# EasyEDA Pro project ProPrj_CraftVia-Core-S-G431-v1-Rev0_2026-10-26.epro

# Schematic Core-S-G431-v1-Rev0
Board Name: Board1; Create Date: 2026-09-03; Page Name: P1; Project Name: CraftVia-Core-S-G431-v1-Rev0; Schematic Name: Schematic1; Update Date: 2026-09-03; Company: CraftVia.org; Page Size: A3; Version: V1 Rev0
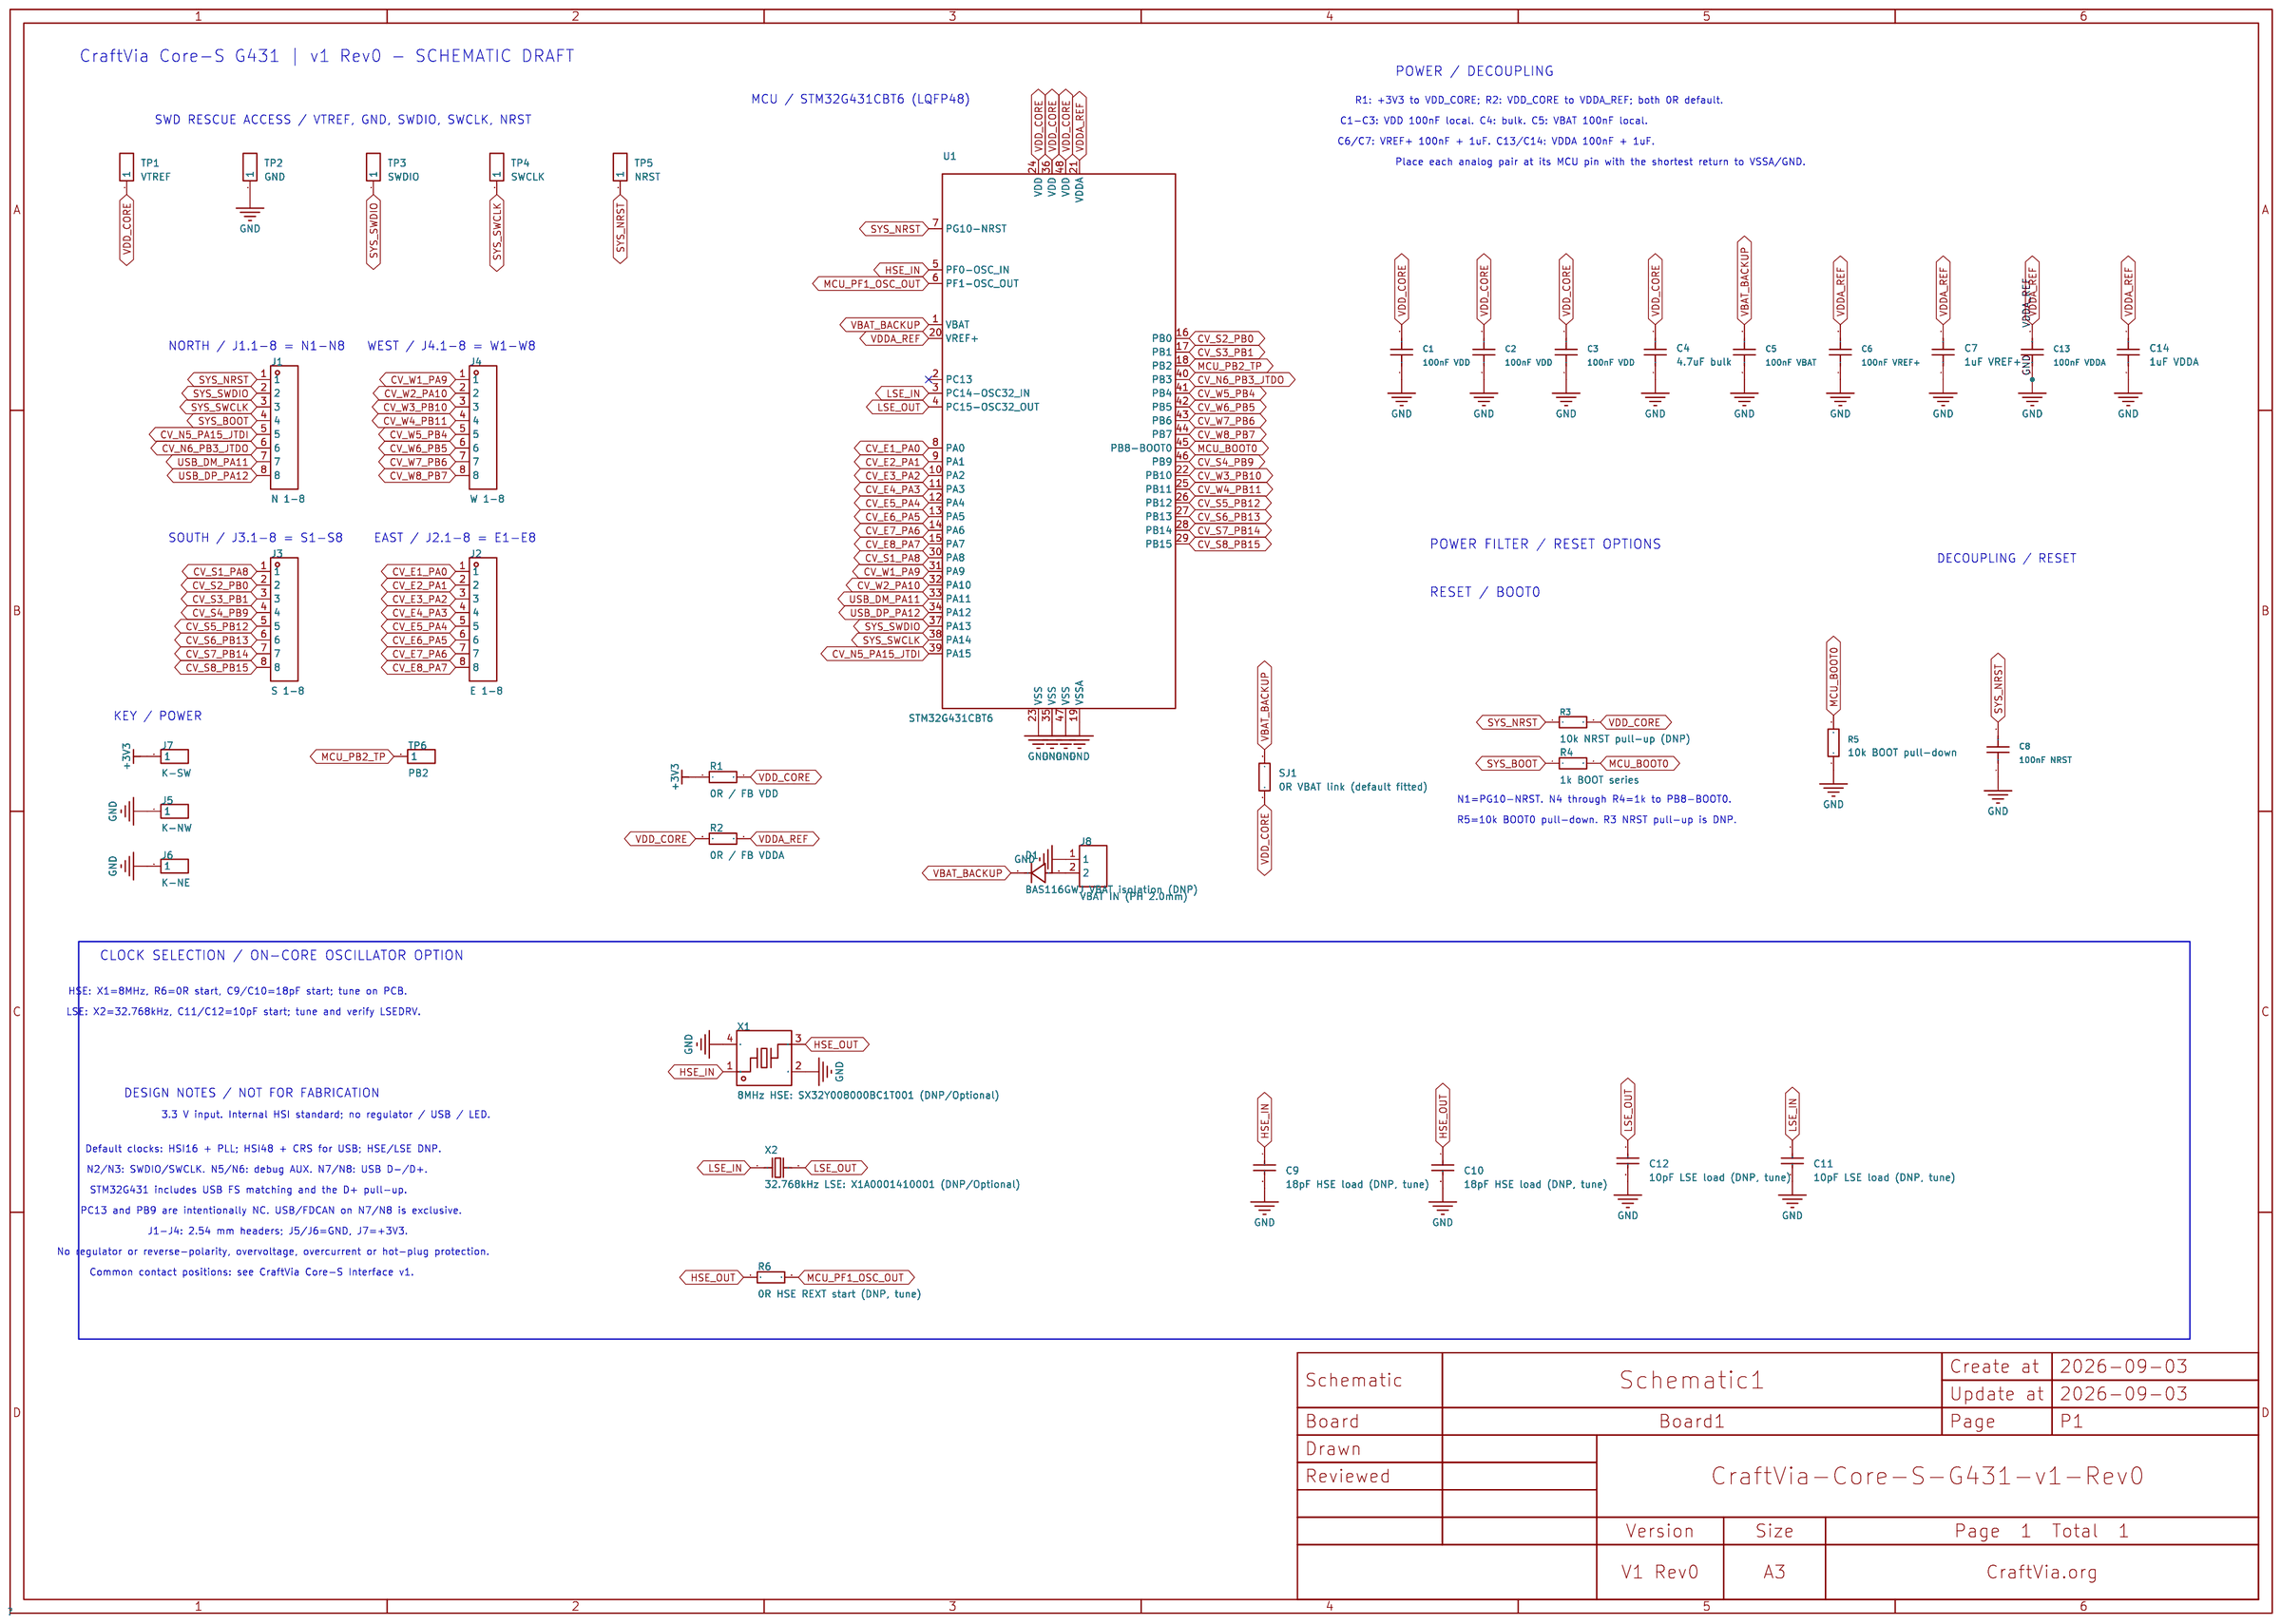
[diagram p0: schematic sheet]

## Parts
C1  100nF  [C0603]
C2  100nF  [C0603]
C3  100nF  [C0603]
C4  4.7uF  [C0603]
C5  100nF  [C0603]
C6  100nF  [C0603]
C7  1uF  [C0603]
C8  100nF  [C0603]
C9  18pF  [C0603]
C10  18pF  [C0603]
C11  10pF  [C0603]
C12  10pF  [C0603]
C13  100nF  [C0603]
C14  1uF  [C0603]
D1  BAS116GWJ VBAT isolation (DNP)  [SOD-123_L2.8-W1.6-LS3.7-RD]
J1  N 1-8  [HDR-TH_8P-P2.54-V-M]
J2  E 1-8  [HDR-TH_8P-P2.54-V-M]
J3  S 1-8  [HDR-TH_8P-P2.54-V-M]
J4  W 1-8  [HDR-TH_8P-P2.54-V-M]
J5  K-NW  [HDR-TH_1P-P2.54-V-M]
J6  K-NE  [HDR-TH_1P-P2.54-V-M]
J7  K-SW  [HDR-TH_1P-P2.54-V-M]
J8  VBAT IN (PH 2.0mm)  [CONN-TH_B2B-PH-K-S]
R1  0R  [R0603]
R2  0R  [R0603]
R3  10k  [R0603]
R4  1k  [R0603]
R5  10k  [R0603]
R6  0R  [R0603]
SJ1  0R  [R0603]
TP1  VTREF  [HDR-TH_1P-P2.54-V-M]  (no BOM)
TP2  GND  [HDR-TH_1P-P2.54-V-M]  (no BOM)
TP3  SWDIO  [HDR-TH_1P-P2.54-V-M]  (no BOM)
TP4  SWCLK  [HDR-TH_1P-P2.54-V-M]  (no BOM)
TP5  NRST  [HDR-TH_1P-P2.54-V-M]  (no BOM)
TP6  PB2  [HDR-TH_1P-P2.54-V-M]  (no BOM)
U1  STM32G431CBT6  [LQFP-48_L7.0-W7.0-P0.50-LS9.0-BL]
X1  8.000MHz  [CRYSTAL-SMD_4P-L3.2-W2.5-BL]
X2  32.768kHz  [OSC-SMD_L3.2-W1.5]

## Library data of the parts
C1-C3 C5 C8 = CC0603KRX7R9BB104: Capacitance:100nF Tolerance:±10% Tolerance:±10% Voltage Rating:50V Temperature Coefficient:X7R; LCSC Part Name: 100nF ±10% 50V; Supplier Part: CC0603KRX7R9BB104.1; Manufacturer: YAGEO(国巨); Supplier Footprint: 0603; JLCPCB Part Class: Basic Part; Datasheet: https://item.szlcsc.com/datasheet/CC0603KRX7R9BB104/15331.html; Supplier: LCSC; Tolerance: ±10%; Voltage Rating: 50V; Temperature Coefficient: X7R
C4 = CL10A475KO8NNNC: Capacitance:4.7uF Tolerance:±10% Tolerance:±10% Voltage Rating:16V Temperature Coefficient:X5R; LCSC Part Name: 4.7uF ±10% 16V; Supplier Part: CL10A475KO8NNNC.1; Manufacturer: SAMSUNG(三星); Supplier Footprint: 0603; JLCPCB Part Class: Basic Part; Datasheet: https://item.szlcsc.com/datasheet/CL10A475KO8NNNC/20375.html; Supplier: LCSC; Tolerance: ±10%; Voltage Rating: 16V; Temperature Coefficient: X5R
C6 = CC0603KRX7R9BB104: VREF+ local decoupling; place at U1 pin 20 with shortest return to VSSA pin 19; LCSC Part Name: 100nF ±10% 50V; Supplier Part: CC0603KRX7R9BB104.1; Manufacturer: YAGEO(国巨); Supplier Footprint: 0603; JLCPCB Part Class: Basic Part; Datasheet: https://item.szlcsc.com/datasheet/CC0603KRX7R9BB104/15331.html; Supplier: LCSC; Tolerance: ±10%; Voltage Rating: 50V; Temperature Coefficient: X7R
C7 = CL10A105KB8NNNC: VREF+ local bulk decoupling; place at U1 pin 20 with shortest return to VSSA pin 19; LCSC Part Name: 1uF ±10% 50V; Supplier Part: CL10A105KB8NNNC.1; Manufacturer: SAMSUNG(三星); Supplier Footprint: 0603; JLCPCB Part Class: Basic Part; Datasheet: https://item.szlcsc.com/datasheet/CL10A105KB8NNNC/16531.html; Supplier: LCSC; Tolerance: ±10%; Voltage Rating: 50V; Temperature Coefficient: X5R
C9 C10 = CL10C180JB8NNNC: HSE load capacitor nominal start value for X1 CL=12pF; tune for PCB stray capacitance and startup margin; LCSC Part Name: 18pF ±5% 50V; Supplier Part: CL10C180JB8NNNC.1; Manufacturer: SAMSUNG(三星); Supplier Footprint: 0603; JLCPCB Part Class: Basic Part; Datasheet: https://item.szlcsc.com/datasheet/CL10C180JB8NNNC/1999.html; Supplier: LCSC; Tolerance: ±5%; Voltage Rating: 50V; Temperature Coefficient: C0G; Assembly: DNP / Populate for HSE variant; BOM Status: DNP; Populate: No; DNP: Yes
C11 C12 = CL10C100JB8NNNC: LSE load capacitor nominal start value for X2 CL=7pF; tune for PCB stray capacitance and startup margin; LCSC Part Name: 10pF ±5% 50V; Supplier Part: CL10C100JB8NNNC.1; Manufacturer: SAMSUNG(三星); Supplier Footprint: 0603; JLCPCB Part Class: Basic Part; Datasheet: https://item.szlcsc.com/datasheet/CL10C100JB8NNNC/1986.html; Supplier: LCSC; Tolerance: ±5%; Voltage Rating: 50V; Temperature Coefficient: C0G; Assembly: DNP / Populate for LSE variant; BOM Status: DNP; Populate: No; DNP: Yes
C13 = CC0603KRX7R9BB104: VDDA local decoupling; place at U1 pin 21 with shortest return to VSSA pin 19; LCSC Part Name: 100nF ±10% 50V; Supplier Part: C14663; Manufacturer: YAGEO(国巨); Supplier Footprint: 0603; JLCPCB Part Class: Basic Part; Datasheet: https://item.szlcsc.com/datasheet/CC0603KRX7R9BB104/15331.html; Supplier: LCSC; Tolerance: ±10%; Voltage Rating: 50V; Temperature Coefficient: X7R
C14 = CL10A105KB8NNNC: VDDA local bulk decoupling; place at U1 pin 21 with shortest return to VSSA pin 19; LCSC Part Name: 1uF ±10% 50V; Supplier Part: CL10A105KB8NNNC.1; Manufacturer: SAMSUNG(三星); Supplier Footprint: 0603; JLCPCB Part Class: Basic Part; Datasheet: https://item.szlcsc.com/datasheet/CL10A105KB8NNNC/16531.html; Supplier: LCSC; Tolerance: ±10%; Voltage Rating: 50V; Temperature Coefficient: X5R
D1 = BAS116GWJ: Optional low-leakage series isolation diode for external VBAT; populate for direct primary-cell use; anode to J8 VBAT+, cathode to VBAT_BACKUP; LCSC Part Name: 85V 215mA; Supplier Part: BAS116GWJ.1; Manufacturer: Nexperia(安世); Supplier Footprint: SOD-123; JLCPCB Part Class: Extended Part; Datasheet: https://item.szlcsc.com/datasheet/BAS116GWJ/570261.html; Supplier: LCSC; Diode Configuration: Independent; Current - Rectified: 215mA; Voltage - DC Reverse(Vr): 85V; Voltage - Forward(Vf@If): 1.25V@150mA; Reverse Leakage Current (Ir): 5nA@75V; Reverse Recovery Time (trr): 800ns; Assembly: DNP; DNP: Yes
J1-J4 = 直排针2.54mm 1*8P: Circluar Pins/Square Pins:- Current Rating (Max):- Voltage Rating (Max):- Length of Mating Pin:- Insulation Height:- Contact Material:; LCSC Part Name: 直排针 2.54mm 1*8P; Supplier Part: Header2.54mm 1*8P.1; Supplier Footprint: 插件; JLCPCB Part Class: Extended Part; Supplier: LCSC
J5-J7 TP1-TP5 = 2.54-1*1P针: Pin Structure:1x1P Pitch:- Row Spacing:- Circluar Pins/Square Pins:Pin Header Mounting Type:Through Hole Number of Rows:1 Number of Pins:1P Current Rating:3A Voltage Rating (Max):- Length of Mating Pin:6mm Insulation Height:2.5mm Length of End Connection; LCSC Part Name: 1x1P 方针 直插; Supplier Part: Header-Male-2.54_1x1.1; Manufacturer: BOOMELE(博穆精密); Supplier Footprint: 插件,P=2.54mm; JLCPCB Part Class: Extended Part; Datasheet: https://item.szlcsc.com/datasheet/2.54-1*1P%25E9%2592%2588/82426.html; Supplier: LCSC; Pin Structure: 1x1P; Circluar Pins/Square Pins: Pin Header; Mounting Type: Through Hole; Number of Rows: 1; Number of Pins: 1P; Current Rating: 3A; Length of Mating Pin: 6mm; Insulation Height: 2.5mm; Length of End Connection Pin: 3mm; Contact Material: Brass; Contact Plating: Gold; Operating Temperature: -55℃~+105℃; Color: Black
J8 = XY-B2B-PH-K-S: External VBAT input. Populate D1 and remove SJ1 before connecting a primary cell.; LCSC Part Name: 1x2P 间距:2mm 直插; Supplier Part: XY-B2B-PH-K-S.1; Manufacturer: XYECONN(辛译); Supplier Footprint: 插件,P=2mm; JLCPCB Part Class: Extended Part; Datasheet: https://item.szlcsc.com/datasheet/XY-B2B-PH-K-S/54660507.html; Supplier: LCSC; Pins Structure: 1x2P; Pitch: 2mm; Mounting Type: Through Hole; Number of Pins: 2P; Number of Rows: 1; Number of PINs Per Row: 2; Current Rating: 2A; Contact Material: Brass; Contact Plating: Tin; Operating Temperature: -25℃~+85℃; Voltage Rating: 250V; Plastic Material: PA66; Flame Retardant Rating: UL94V-0; Color: White; Z-Height of the Board: 6.05mm; X-Length of Bottom Edge on Board (Spacing Line): 6mm; Y-Width of Bottom Edge on Board: 4.7mm; DNP: Yes; Assembly: DNP / External VBAT option; BOM Status: DNP; Populate: No
R1 R2 = 0603WAF0000T5E: Type:Thick Film Resistor Resistance:0Ω Tolerance:±1% Tolerance:±1% Power(Watts):100mW Voltage-Supply(Max):75V Temperature Coefficient:- Temperature Coefficient:- Operating Temperature:-55℃~+155℃ Operating Temperature:-55℃~+155℃; LCSC Part Name: 厚膜电阻 0Ω ±1%; Supplier Part: 0603WAF0000T5E.1; Manufacturer: UNI-ROYAL(厚声); Supplier Footprint: 0603; JLCPCB Part Class: Basic Part; Datasheet: https://item.szlcsc.com/datasheet/0603WAF0000T5E/21903.html; Supplier: LCSC; Type: Thick Film Resistor; Tolerance: ±1%; Power(Watts): 100mW; Voltage-Supply(Max): 75V; Operating Temperature: -55℃~+155℃
R3 = 0603WAF1002T5E: Optional external NRST pull-up; standard assembly DNP; LCSC Part Name: 厚膜电阻 10kΩ ±1% 100mW; Supplier Part: 0603WAF1002T5E.1; Manufacturer: UNI-ROYAL(厚声); Supplier Footprint: 0603; JLCPCB Part Class: Basic Part; Datasheet: https://item.szlcsc.com/datasheet/0603WAF1002T5E/26547.html; Supplier: LCSC; Type: Thick Film Resistor; Tolerance: ±1%; Power(Watts): 100mW; Voltage-Supply(Max): 75V; Temperature Coefficient: ±100ppm/℃; Operating Temperature: -55℃~+155℃; Assembly: DNP / Optional NRST pull-up; BOM Status: DNP; Populate: No; DNP: Yes
R4 = 0603WAF1001T5E: Type:Thick Film Resistor Resistance:1kΩ Tolerance:±1% Tolerance:±1% Power(Watts):100mW Voltage-Supply(Max):75V Temperature Coefficient:±100ppm/℃ Temperature Coefficient:±100ppm/℃ Operating Temperature:-55℃~+155℃ Operating Temperature:-55℃~+155℃; LCSC Part Name: 1kΩ ±1% 100mW 厚膜电阻; Supplier Part: 0603WAF1001T5E.1; Manufacturer: UNI-ROYAL(厚声); Supplier Footprint: 0603; JLCPCB Part Class: Basic Part; Datasheet: https://item.szlcsc.com/datasheet/0603WAF1001T5E/21904.html; Supplier: LCSC; Type: Thick Film Resistor; Tolerance: ±1%; Power(Watts): 100mW; Voltage-Supply(Max): 75V; Temperature Coefficient: ±100ppm/℃; Operating Temperature: -55℃~+155℃
R5 = 0603WAF1002T5E: Type:Thick Film Resistor Resistance:10kΩ Tolerance:±1% Tolerance:±1% Power(Watts):100mW Voltage-Supply(Max):75V Temperature Coefficient:±100ppm/℃ Temperature Coefficient:±100ppm/℃ Operating Temperature:-55℃~+155℃ Operating Temperature:-55℃~+155℃; LCSC Part Name: 厚膜电阻 10kΩ ±1% 100mW; Supplier Part: 0603WAF1002T5E.1; Manufacturer: UNI-ROYAL(厚声); Supplier Footprint: 0603; JLCPCB Part Class: Basic Part; Datasheet: https://item.szlcsc.com/datasheet/0603WAF1002T5E/26547.html; Supplier: LCSC; Type: Thick Film Resistor; Tolerance: ±1%; Power(Watts): 100mW; Voltage-Supply(Max): 75V; Temperature Coefficient: ±100ppm/℃; Operating Temperature: -55℃~+155℃
R6 = 0603WAF0000T5E: Series REXT on OSC_OUT; start with 0R for bring-up, then verify drive level and negative-resistance margin; LCSC Part Name: 厚膜电阻 0Ω ±1%; Supplier Part: 0603WAF0000T5E.1; Manufacturer: UNI-ROYAL(厚声); Supplier Footprint: 0603; JLCPCB Part Class: Basic Part; Datasheet: https://item.szlcsc.com/datasheet/0603WAF0000T5E/21903.html; Supplier: LCSC; Type: Chip resistor; Tolerance: ±1%; Power(Watts): 0.1W; Voltage-Supply(Max): 75V; Operating Temperature: -55℃~+155℃; Assembly: DNP / Populate for HSE variant; BOM Status: DNP; Populate: No; DNP: Yes
SJ1 = 0603WAF0000T5E: Default fitted: VBAT follows VDD_CORE; remove SJ1 and populate D1 before applying external VBAT via J8; LCSC Part Name: 厚膜电阻 0Ω ±1%; Supplier Part: 0603WAF0000T5E.1; Manufacturer: UNI-ROYAL(厚声); Supplier Footprint: 0603; JLCPCB Part Class: Basic Part; Datasheet: https://item.szlcsc.com/datasheet/0603WAF0000T5E/21903.html; Supplier: LCSC; Type: Thick Film Resistor; Tolerance: ±1%; Power(Watts): 100mW; Voltage-Supply(Max): 75V; Operating Temperature: -55℃~+155℃; Assembly: Populate by default / remove for external VBAT
TP6 = 2.54-1*1P针: Pin Structure:1x1P Pitch:- Row Spacing:- Circluar Pins/Square Pins:Pin Header Mounting Type:Through Hole Number of Rows:1 Number of Pins:1P Current Rating:3A Voltage Rating (Max):- Length of Mating Pin:6mm Insulation Height:2.5mm Length of End Connection; LCSC Part Name: 1x1P 方针 直插; Supplier Part: C81276; Manufacturer: BOOMELE(博穆精密); Supplier Footprint: 插件,P=2.54mm; JLCPCB Part Class: Extended Part; Datasheet: https://item.szlcsc.com/datasheet/2.54-1*1P%25E9%2592%2588/82426.html; Supplier: LCSC; Pin Structure: 1x1P; Circluar Pins/Square Pins: Pin Header; Mounting Type: Through Hole; Number of Rows: 1; Number of Pins: 1P; Current Rating: 3A; Length of Mating Pin: 6mm; Insulation Height: 2.5mm; Length of End Connection Pin: 3mm; Contact Material: Brass; Contact Plating: Gold; Operating Temperature: -55℃~+105℃; Color: Black
U1 = STM32G431CBT6: CPU Core:ARM Cortex-M4F CPU Maximum Speed:170MHz Core Size:32 Bit Program Storage Size:128KB Program Memory Type:FLASH RAM Size:32KB EEPROM:- Number of I/O:38 ADC (Bit):12bit DAC (Bit):12bit Oscillator Type:Built-in Voltage - Supply:1.71V~3.6V Voltage - S; LCSC Part Name: 带DSP和FPU的170MHz主流ARM Cortex-M4 MCU，具有128 KB Flash存储器、数学加速器和中等模拟电平集成; Supplier Part: STM32G431CBT6.1; Manufacturer: ST(意法半导体); Supplier Footprint: LQFP-48(7x7); JLCPCB Part Class: Extended Part; Datasheet: https://item.szlcsc.com/datasheet/STM32G431CBT6/549633.html; Supplier: LCSC; CPU Core: ARM Cortex-M4F; CPU Maximum Speed: 170MHz; Core Size: 32 Bit; Program Storage Size: 128KB; Program Memory Type: FLASH; RAM Size: 32KB; Number of I/O: 38; ADC (Bit): 12bit; DAC (Bit): 12bit; Oscillator Type: Built-in; Voltage - Supply: 1.71V~3.6V; Operating Temperature: -40℃~+85℃
X1 = SX32Y008000BC1T001: Primary HSE crystal, SMD 3225 4-pin; standard assembly DNP; validate load, startup and drive level on PCB; LCSC Part Name: 8MHz ±10ppm 12pF; Supplier Part: SX32Y008000BC1T001.1; Manufacturer: TKD(泰晶); Supplier Footprint: SMD3225-4P; JLCPCB Part Class: Extended Part; Datasheet: https://item.szlcsc.com/datasheet/SX32Y008000BC1T001/21988737.html; Supplier: LCSC; Type: Passive crystal; Normal temperature Frequency Tolerance: ±10ppm; Load Capacitance: 12pF; Frequency Stability: ±30ppm; Equivalent Series Resistance(ESR): 300Ω max; Operating Temperature: -40°C to +85°C; Assembly: DNP / Optional HSE; LCSC Part: C20617233; BOM Status: DNP; Populate: No; DNP: Yes
X2 = X1A0001410001: Primary LSE crystal, Epson FC-135R 3215; standard assembly DNP; tune load capacitors and configure LSEDRV; LCSC Part Name: 32.768kHz ±20ppm 7pF; Supplier Part: FC-135R32.768kHz7.0pF20PPM.1; Manufacturer: EPSON(爱普生); Supplier Footprint: SMD3215-2P; JLCPCB Part Class: Extended Part; Datasheet: https://item.szlcsc.com/datasheet/X1A0001410001/95872.html; Supplier: LCSC; Type: Tuning-fork crystal; Normal temperature Frequency Tolerance: ±20ppm; Load Capacitance: 7pF; Equivalent Series Resistance(ESR): 50kΩ max; Operating Temperature: -40°C to +85°C; Assembly: DNP / Optional LSE; LCSC Part: C94674; BOM Status: DNP; Populate: No; DNP: Yes

## Nets
+3V3: J7.1 R1.1
GND: C1.1 C2.1 C3.1 C4.1 C5.1 C6.1 C7.1 C8.1 C9.2 C10.2 C11.2 C12.2 C13.1 C14.1 J5.1 J6.1 J8.1 R5.1 TP2.1 U1.19(VSSA) U1.23(VSS) U1.35(VSS) U1.47(VSS) X1.2(GND) X1.4(GND)
VBAT_BACKUP: C5.2 D1.1(K) SJ1.2 U1.1(VBAT)
VDD_CORE: C1.2 C2.2 C3.2 C4.2 R1.2 R2.1 R3.2 SJ1.1 TP1.1 U1.24(VDD) U1.36(VDD) U1.48(VDD)
VDDA_REF: C6.2 C7.2 C13.2 C14.2 R2.2 U1.20(VREF+) U1.21(VDDA)
CV_E1_PA0: J2.1 U1.8(PA0)
CV_E2_PA1: J2.2 U1.9(PA1)
CV_E3_PA2: J2.3 U1.10(PA2)
CV_E4_PA3: J2.4 U1.11(PA3)
CV_E5_PA4: J2.5 U1.12(PA4)
CV_E6_PA5: J2.6 U1.13(PA5)
CV_E7_PA6: J2.7 U1.14(PA6)
CV_E8_PA7: J2.8 U1.15(PA7)
CV_N5_PA15_JTDI: J1.5 U1.39(PA15)
CV_N6_PB3_JTDO: J1.6 U1.40(PB3)
CV_S1_PA8: J3.1 U1.30(PA8)
CV_S2_PB0: J3.2 U1.16(PB0)
CV_S3_PB1: J3.3 U1.17(PB1)
CV_S4_PB9: J3.4 U1.46(PB9)
CV_S5_PB12: J3.5 U1.26(PB12)
CV_S6_PB13: J3.6 U1.27(PB13)
CV_S7_PB14: J3.7 U1.28(PB14)
CV_S8_PB15: J3.8 U1.29(PB15)
CV_W1_PA9: J4.1 U1.31(PA9)
CV_W2_PA10: J4.2 U1.32(PA10)
CV_W3_PB10: J4.3 U1.22(PB10)
CV_W4_PB11: J4.4 U1.25(PB11)
CV_W5_PB4: J4.5 U1.41(PB4)
CV_W6_PB5: J4.6 U1.42(PB5)
CV_W7_PB6: J4.7 U1.43(PB6)
CV_W8_PB7: J4.8 U1.44(PB7)
HSE_IN: C9.1 U1.5(PF0-OSC_IN) X1.1(CRYSTAL)
HSE_OUT: C10.1 R6.1 X1.3(CRYSTAL)
LSE_IN: C11.1 U1.3(PC14-OSC32_IN) X2.1
LSE_OUT: C12.1 U1.4(PC15-OSC32_OUT) X2.2
MCU_BOOT0: R4.2 R5.2 U1.45(PB8-BOOT0)
MCU_PB2_TP: TP6.1 U1.18(PB2)
MCU_PF1_OSC_OUT: R6.2 U1.6(PF1-OSC_OUT)
SYS_BOOT: J1.4 R4.1
SYS_NRST: C8.2 J1.1 R3.1 TP5.1 U1.7(PG10-NRST)
SYS_SWCLK: J1.3 TP4.1 U1.38(PA14)
SYS_SWDIO: J1.2 TP3.1 U1.37(PA13)
USB_DM_PA11: J1.7 U1.33(PA11)
USB_DP_PA12: J1.8 U1.34(PA12)
$1N514: D1.2(A) J8.2

Not connected (* = marked no-connect by the designer): U1 2(PC13)*

## Notes on the sheet
- CraftVia Core-S G431 | v1 Rev0 - SCHEMATIC DRAFT
- POWER / DECOUPLING
- MCU / STM32G431CBT6 (LQFP48)
- R1: +3V3 to VDD_CORE; R2: VDD_CORE to VDDA_REF; both 0R default.
- SWD RESCUE ACCESS / VTREF, GND, SWDIO, SWCLK, NRST
- C1-C3: VDD 100nF local. C4: bulk. C5: VBAT 100nF local.
- C6/C7: VREF+ 100nF + 1uF. C13/C14: VDDA 100nF + 1uF.
- Place each analog pair at its MCU pin with the shortest return to VSSA/GND.
- NORTH / J1.1-8 = N1-N8
- WEST / J4.1-8 = W1-W8
- SOUTH / J3.1-8 = S1-S8
- EAST / J2.1-8 = E1-E8
- POWER FILTER / RESET OPTIONS
- DECOUPLING / RESET
- RESET / BOOT0
- KEY / POWER
- N1=PG10-NRST. N4 through R4=1k to PB8-BOOT0.
- R5=10k BOOT0 pull-down. R3 NRST pull-up is DNP.
- CLOCK SELECTION / ON-CORE OSCILLATOR OPTION
- HSE: X1=8MHz, R6=0R start, C9/C10=18pF start; tune on PCB.
- LSE: X2=32.768kHz, C11/C12=10pF start; tune and verify LSEDRV.
- DESIGN NOTES / NOT FOR FABRICATION
- 3.3 V input. Internal HSI standard; no regulator / USB / LED.
- Default clocks: HSI16 + PLL; HSI48 + CRS for USB; HSE/LSE DNP.
- N2/N3: SWDIO/SWCLK. N5/N6: debug AUX. N7/N8: USB D-/D+.
- STM32G431 includes USB FS matching and the D+ pull-up.
- PC13 and PB9 are intentionally NC. USB/FDCAN on N7/N8 is exclusive.
- J1-J4: 2.54 mm headers; J5/J6=GND, J7=+3V3.
- No regulator or reverse-polarity, overvoltage, overcurrent or hot-plug protection.
- Common contact positions: see CraftVia Core-S Interface v1.

# Board PCB1
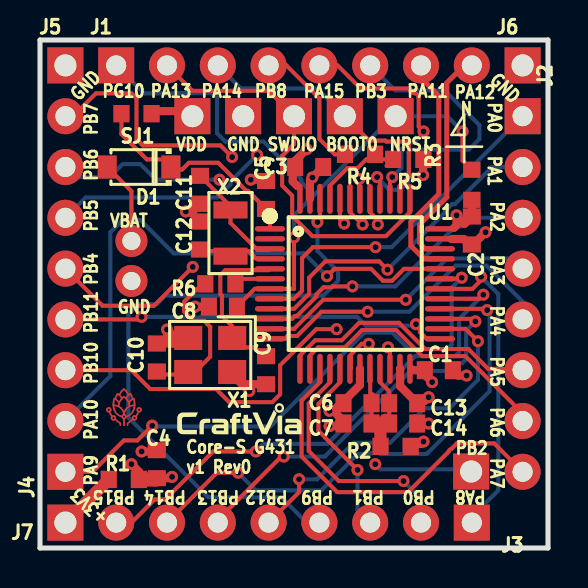
[diagram p1: board, top side]
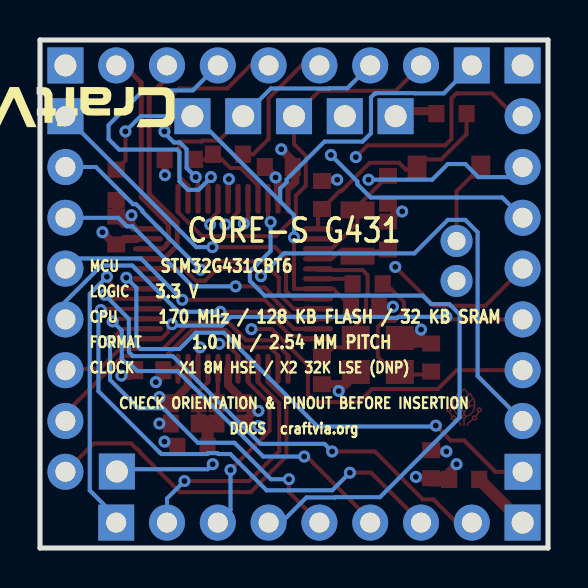
[diagram p2: board, bottom side, seen from below]

Outline 25.4 x 25.4 mm; copper layers: Top Layer, GND Plane, Power / Signal, Bottom Layer. Coordinates in mm from the lower left corner of the outline.
Outline path: 0,25.4 0,0 25.4,0 25.4,25.4 0,25.4
Stack: Top Layer 0.035mm Outer layer thickness 1oz / Dielectric1 0.2104mm 7628 RC49% 8.6mil / GND Plane 0.035mm / Dielectric2 1.065mm 1.1mm H/HOZ Copper / Power / Signal 0.035mm / Dielectric3 0.2104mm 7628 RC49% 8.6mil / Bottom Layer 0.035mm Outer layer thickness 1oz

## Design rules (mm)
net USB_DM_PA11: USB_FS
net USB_DP_PA12: USB_FS
spacing copperThickness1oz (default): track to track 0.152, other pairs 0.152 to 0.3
spacing copperThickness2oz: track to track 0.203, other pairs 0.152 to 0.3
track width copperThickness1oz (default): min 0.152, default 0.203, max 2.54
track width copperThickness2oz: min 0.203, default 0.254, max 2.54
track width powerTrack: min 0.254, default 0.406, max 2.54
differential pair differentialPair (default): width min 0.247, default 0.247, max 0.247; gap min 0.152, default 0.152
net VDD_CORE uses powerTrack
net GND uses powerTrack
net +3V3 uses powerTrack

## Placement (name value [footprint] x y rotation side)
C1  100nF  [C0603]  19.94 8.89 180 top
C2  100nF  [C0603]  21.59 15.88 90 top
C3  100nF  [C0603]  13.46 19.05 180 top
C4  4.7uF  [C0603]  5.84 4.19 270 top
C5  100nF  [C0603]  11.3 17.65 270 top
C6  100nF  [C0603]  15.88 7.24 0 top
C7  1uF  [C0603]  15.88 6.22 0 top
C8  100nF  [C0603]  9.14 12.06 0 top
C9  18pF  [C0603]  11.3 8.89 270 top
C10  18pF  [C0603]  5.84 9.53 90 top
C11  10pF  [C0603]  8 17.91 270 top
C12  10pF  [C0603]  8 15.62 90 top
C13  100nF  [C0603]  18.16 7.24 180 top
C14  1uF  [C0603]  18.16 6.22 180 top
D1  BAS116GWJ VBAT isolation (DNP)  [SOD-123_L2.8-W1.6-LS3.7-RD]  4.95 19.05 180 top
J1  N 1-8  [HDR-TH_8P-P2.54-V-M]  12.7 24.13 0 top
J2  E 1-8  [HDR-TH_8P-P2.54-V-M]  24.13 12.7 270 top
J3  S 1-8  [HDR-TH_8P-P2.54-V-M]  12.7 1.27 180 top
J4  W 1-8  [HDR-TH_8P-P2.54-V-M]  1.27 12.7 90 top
J5  K-NW  [HDR-TH_1P-P2.54-V-M]  1.27 24.13 0 top
J6  K-NE  [HDR-TH_1P-P2.54-V-M]  24.13 24.13 0 top
J7  K-SW  [HDR-TH_1P-P2.54-V-M]  1.27 1.27 0 top
J8  VBAT IN (PH 2.0mm)  [CONN-TH_B2B-PH-K-S]  4.57 14.35 270 top
R1  0R  [R0603]  4.19 3.43 0 top
R2  0R  [R0603]  17.78 5.08 180 top
R3  10k  [R0603]  21.59 18.16 270 top
R4  1k  [R0603]  16 19.69 0 top
R5  10k  [R0603]  18.41 19.43 180 top
R6  0R  [R0603]  9.02 13.21 0 top
SJ1  0R  [R0603]  4.83 21.72 180 top
TP1  VTREF  [HDR-TH_1P-P2.54-V-M]  7.62 21.59 0 top
TP2  GND  [HDR-TH_1P-P2.54-V-M]  10.16 21.59 0 top
TP3  SWDIO  [HDR-TH_1P-P2.54-V-M]  12.7 21.59 0 top
TP4  SWCLK  [HDR-TH_1P-P2.54-V-M]  15.24 21.59 0 top
TP5  NRST  [HDR-TH_1P-P2.54-V-M]  17.78 21.59 0 top
TP6  PB2  [HDR-TH_1P-P2.54-V-M]  21.56 3.82 0 top
U1  STM32G431CBT6  [LQFP-48_L7.0-W7.0-P0.50-LS9.0-BL]  15.75 13.21 270 top
X1  8.000MHz  [CRYSTAL-SMD_4P-L3.2-W2.5-BL]  8.51 9.65 180 top
X2  32.768kHz  [OSC-SMD_L3.2-W1.5]  9.53 15.75 270 top

## Footprints (pads in the part's own frame, mm; a bottom-side part is the same pattern mirrored in y, then rotated)
C0603
  rect 0.8x0.9 smd: 1(-0.7,0) 2(0.7,0)
CONN-TH_B2B-PH-K-S
  round 1.6 hole 0.9: 1(1,0) 2(-1,0)
CRYSTAL-SMD_4P-L3.2-W2.5-BL
  rect 1.4x1.2 smd: 1(-1.1,-0.85) 2(1.1,-0.85) 3(1.1,0.85) 4(-1.1,0.85)
HDR-TH_1P-P2.54-V-M
  rect 1.8x1.8 hole 1.1: 1(0,0)
HDR-TH_8P-P2.54-V-M
  rect 1.8x1.8 hole 1: 1(-8.89,0)
  round 1.801 hole 1: 2(-6.35,0) 3(-3.81,0) 4(-1.27,0) 5(1.27,0) 6(3.81,0) 7(6.35,0) 8(8.89,0)
LQFP-48_L7.0-W7.0-P0.50-LS9.0-BL
  oval 0.27x1.5 smd: 1(-2.75,-4.25) 2(-2.25,-4.25) 3(-1.75,-4.25) 4(-1.25,-4.25) 5(-0.75,-4.25) 6(-0.25,-4.25) 7(0.25,-4.25) 8(0.75,-4.25) 9(1.25,-4.25) 10(1.75,-4.25) 11(2.25,-4.25) 12(2.75,-4.25) 25(2.75,4.25) 26(2.25,4.25) 27(1.75,4.25) 28(1.25,4.25) 29(0.75,4.25) 30(0.25,4.25) 31(-0.25,4.25) 32(-0.75,4.25) 33(-1.25,4.25) 34(-1.75,4.25) 35(-2.25,4.25) 36(-2.75,4.25)
  oval 1.5x0.27 smd: 13(4.25,-2.75) 14(4.25,-2.25) 15(4.25,-1.75) 16(4.25,-1.25) 17(4.25,-0.75) 18(4.25,-0.25) 19(4.25,0.25) 20(4.25,0.75) 21(4.25,1.25) 22(4.25,1.75) 23(4.25,2.25) 24(4.25,2.75) 37(-4.25,2.75) 38(-4.25,2.25) 39(-4.25,1.75) 40(-4.25,1.25) 41(-4.25,0.75) 42(-4.25,0.25) 43(-4.25,-0.25) 44(-4.25,-0.75) 45(-4.25,-1.25) 46(-4.25,-1.75) 47(-4.25,-2.25) 48(-4.25,-2.75)
OSC-SMD_L3.2-W1.5
  rect 0.85x1.7 smd: 1(-1.155,0) 2(1.155,0)
R0603
  rect 0.806x0.864 smd: 1(-0.753,0) 2(0.753,0)
SOD-123_L2.8-W1.6-LS3.7-RD
  rect 0.95x1.15 smd: 1(-1.593,0) 2(1.593,0)

## Nets
As in the schematic.

Pads without a net: U1 2

## Via types
v1: diameter 0.6, hole 0.3, Top Layer to Bottom Layer, 59 vias

## Routing (per net, layer and track width the routed paths; a pad name or vN(x,y) marks a point on that pad's centre or on a via; arc(x,y) is an arc through that point)
+3V3: length 3.1
  Top Layer w0.606: R1.1 1.28,1.27 J7.1
GND: length 22.2
  Top Layer w0.406: 11.3,18.35 11.24,18.42 v1(10.54,18.42) ; v1(10.47,7.85) 10.12,8.19 ; 10.12,8.19 11.18,8.19 ; 10.12,8.19 10.09,8.19 9.61,8.67 ; v1(14.48,6.1) 14.79,6.1 15.11,6.41 ; v1(21.33,8.62) 20.91,8.62 20.64,8.89 ; 7.41,10.38 7.26,10.22 6.64,10.22 ; v1(19.43,7.54) 19.26,7.37 18.73,7.37 18.01,8.09 18.01,8.95 U1.23 ; 7.5,16.83 C12.2 ; 7.5,16.83 7.62,16.83 C11.2 ; 7.5,16.83 v1(7.29,16.83) ; v1(19.15,18.64) 19.15,19.15 19.18,19.18 19.18,19.42 R5.1 ; 6.64,10.22 5.84,10.22 ; 6.64,10.22 6.64,10.63 v1(6.35,10.92) 6.35,10.41 ; 20.57,15.45 21.19,15.45 21.46,15.17 ; C2.1 21.66,15.17 v1(22.28,15.79) ; C4.1 5.78,4.83 v1(5.08,4.83) ; v1(7.75,12.07) 8.44,12.07 ; 14.67,6.86 15.11,6.41 ; 14.67,6.86 v1(14.48,6.86) ; 14.67,6.86 15.18,7.37 ; 15.11,6.41 15.18,6.35 ; 14.03,19.05 14.03,18.94 v1(13.62,18.53) 13.5,18.4 U1.47 ; U1.19 16,8.15 15.22,7.37 ; v1(19.43,6.22) 18.99,6.22 18.73,6.48
VBAT_BACKUP: length 11.3
  Top Layer w0.203: U1.1 11.5,16.76 C5.2 10.4,17.86 10.31,17.86 8.91,19.26 7.45,19.26 7.11,18.92 6.67,18.92 6.16,19.43 5.34,19.43 4.07,20.7 4.07,21.84
VDD_CORE: length 11.1
  Top Layer w0.406: 18.57,8.96 18.63,8.89 C1.2 19.24,8.66 v1(19.61,8.29) ; 21.06,16.36 21.22,16.2 C2.2 R3.2 ; v1(20.83,16.64) 20.83,16.13 20.7,16.01 ; R1.2 4.94,3.82 v1(4.57,4.19) ; 12.88,18.09 12.63,18.33 12.63,19.05 ; C3.2 12.76,19.37 v1(13.34,19.94) ; C4.2 6.54,3.49 v1(6.6,3.56) ; TP1.1 7.37,21.84 5.83,21.84 ; v1(19.18,5.32) 19.06,5.21 18.53,5.21
  Top Layer w0.7: R1.2 5.78,3.43 C4.2
VDDA_REF: length 6.7
  Top Layer w0.203: 16.51,7.68 16.51,8.82 16.5,8.83 U1.20 ; 17.46,6.48 17.46,7.83 17,8.29 U1.21 ; 16.57,6.35 16.57,7.37 ; 16.32,7.37 16.64,7.68
  Top Layer w0.603: 17.03,5.21 17.03,5.33 17.02,5.34 17.02,6.16 17.27,6.41
CV_E1_PA0: length 17.4
  Top Layer w0.203: v1(16.78,15.04) 13.64,15.04 13.1,14.5 13.1,12.86 12.7,12.46 U1.8
  Bottom Layer w0.203: J2.1 17.58,15.04 v1(16.78,15.04)
CV_E2_PA1: length 16.4
  Top Layer w0.203: v1(17.37,13.92) 16.96,14.33 14.27,14.33 13.46,13.52 13.46,12.72 12.7,11.96 U1.9
  Bottom Layer w0.203: v1(17.37,13.92) 20.27,16.82 20.27,16.87 20.6,17.19 20.75,17.19 22.61,19.05 J2.2
CV_E3_PA2: length 14.8
  Top Layer w0.203: v1(15.62,13.08) 14.63,13.08 14.58,13.03 14.18,13.03 13.82,12.67 13.82,12.57 12.85,11.6 12.75,11.6 12.6,11.46 U1.10
  Bottom Layer w0.203: v1(15.62,13.08) 17.77,13.08 20.77,16.08 21.06,16.08 21.48,16.51 J2.3
CV_E4_PA3: length 14.3
  Top Layer w0.203: U1.11 12.71,10.96 14.16,12.41 v1(18.29,12.41)
  Bottom Layer w0.203: J2.4 23.62,14.48 20.35,14.48 v1(18.29,12.41)
CV_E5_PA4: length 15.8
  Top Layer w0.203: v1(16.38,11.81) 14.06,11.81 12.85,10.6 12.38,10.6 12.24,10.46 U1.12
  Bottom Layer w0.203: J2.5 24.13,12.32 22.33,14.12 20.78,14.12 18.47,11.81 v1(16.38,11.81)
CV_E6_PA5: length 13.5
  Top Layer w0.203: U1.13 13,9.63 13.76,10.39 15.09,10.39 15.96,11.26 17.95,11.26 19.26,9.95 21.41,9.95 22.41,8.96 24.06,8.96 J2.6
CV_E7_PA6: length 13.9
  Top Layer w0.203: U1.14 13.5,9.62 13.91,10.03 15.24,10.03 16.11,10.9 17.8,10.9 19.11,9.59 21.27,9.59 24.13,6.73 J2.7
CV_E8_PA7: length 18.2
  Top Layer w0.203: J2.8 22.71,5.23 20.84,5.23 20.58,4.97 arc(20.48,4.9) 20.42,4.8 18.41,2.79 14.86,2.79 13.08,4.57 13.08,7.38 14,8.29 U1.15
CV_N5_PA15_JTDI: length 11.7
  Top Layer w0.203: U1.39 17.5,18.43 v1(17.61,18.55) ; v1(19.18,20.83) 18.93,21.07 18.93,22.49 arc(18.86,22.67) 18.68,22.74 18.45,22.98 16.03,22.98 14.88,24.13 J1.5
  Bottom Layer w0.203: v1(17.61,18.55) 18.07,19 18.07,19.94 18.4,20.27 18.7,20.27 19.18,20.75 v1(19.18,20.83)
CV_N6_PB3_JTDO: length 15.8
  Top Layer w0.203: U1.40 17,18.4 v1(16.86,18.55)
  Bottom Layer w0.203: v1(16.86,18.55) 16.86,18.52 17.47,17.91 18,17.91 18.43,18.33 18.43,19.79 18.55,19.92 21.44,19.92 21.97,20.45 21.97,21.14 20.24,22.88 17.76,22.88 J1.6
CV_S1_PA8: length 15.7
  Top Layer w0.203: U1.30 21.62,12.96 22.14,13.48 v1(22.05,13.56)
  Bottom Layer w0.203: v1(22.05,13.56) 22.91,12.7 22.91,2.88 21.59,1.56 J3.1
CV_S2_PB0: length 12.3
  Top Layer w0.203: v1(18.18,3.35) 14.94,3.35 13.44,4.85 13.44,7.23 14.5,8.29 U1.16
  Bottom Layer w0.203: v1(18.18,3.35) 19.05,2.47 J3.2
CV_S3_PB1: length 9.2
  Top Layer w0.203: U1.17 15,8.29 13.92,7.21 13.92,5.87 14.25,5.54 14.25,5.53 v1(15.88,3.9)
  Bottom Layer w0.203: v1(15.88,3.9) 15.88,1.91 J3.3
CV_S4_PB9: length 32.6
  Top Layer w0.203: U1.46 14,16.42 v1(13.87,16.3)
  Bottom Layer w0.203: v1(13.87,16.3) 13.87,14.85 14.91,13.82 14.91,13.36 14.16,12.62 6.27,12.62 5.84,12.19 4.93,12.19 4.42,11.68 4.42,6.52 8.4,2.54 10.63,2.54 10.64,2.53 12.08,2.53 13.34,1.27 J3.4
CV_S5_PB12: length 17.9
  Top Layer w0.203: v1(12.95,3.44) 12.95,2.79 J3.5 ; v1(21.9,10.34) 21.28,10.96 U1.26
  Bottom Layer w0.203: v1(21.9,10.34) 21.9,8.41 20.48,6.99 19.23,6.99 17.51,5.26 15.68,5.26 13.85,3.44 v1(12.95,3.44)
CV_S6_PB13: length 19.8
  Top Layer w0.203: v1(21.77,11.33) 21.64,11.46 U1.27 ; J3.6 8.89,1.4 12.06,4.57 v1(12.19,4.57)
  Bottom Layer w0.203: v1(12.19,4.57) 14.24,4.57 18.52,8.85 20.53,8.85 20.92,9.24 21.11,9.24 21.31,9.44 21.31,10.87 v1(21.77,11.33)
CV_S7_PB14: length 26.1
  Top Layer w0.203: v1(22.36,11.89) 22.29,11.96 U1.28 ; v1(9.91,3.76) 8.84,3.76 J3.7
  Bottom Layer w0.203: v1(22.36,11.89) 22.48,11.77 22.48,7.84 19.41,4.77 19.39,4.77 19.33,4.7 17.04,4.7 16.99,4.75 16.53,4.75 16.49,4.7 15.89,4.7 14.07,2.88 10.79,2.88 v1(9.91,3.76)
CV_S8_PB15: length 26.3
  Top Layer w0.203: v1(22.17,12.67) 21.96,12.46 20,12.46 U1.29 ; v1(10.79,4.83) 8.66,4.83 6.26,2.42 5.73,2.42 4.57,1.27 J3.8
  Bottom Layer w0.203: v1(22.17,12.67) 20.96,11.45 20.96,9.8 20.75,9.59 18.76,9.59 14.37,5.21 11.18,5.21 v1(10.79,4.83)
CV_W1_PA9: length 27.3
  Top Layer w0.203: U1.31 20,13.46 20.96,13.46 21.01,13.51 v1(21.09,13.51) ; J4.1 2.62,3.81 4.19,5.38 4.87,5.38 5.57,6.08
  Bottom Layer w0.203: v1(21.09,13.51) 20.58,13.01 20.58,10.15 20.38,9.95 18.43,9.95 17.61,10.76 16.21,10.76 11.52,6.08 5.57,6.08
  vias: v1(5.61,6.12)
CV_W2_PA10: length 28.9
  Top Layer w0.203: U1.32 18.2,13.96 17.6,13.36 17.15,13.36 16.55,13.96 14.72,13.96 v1(14.35,13.59)
  Bottom Layer w0.203: v1(14.35,13.59) 13.21,14.73 6.68,14.73 5.01,16.41 4.14,16.41 3.52,15.79 3.52,8.6 J4.2
CV_W3_PB10: length 21
  Top Layer w0.203: v1(17.4,10.03) 17.5,9.93 U1.22 ; J4.3 4.57,8.89 5.51,7.95 8.8,7.95 9.46,7.29 11.61,7.29 12.01,7.69 12.01,9.14 13.81,10.94 v1(14.83,10.94)
  Power / Signal w0.203: v1(17.4,10.03) 17.05,10.03 16.67,9.66 16.12,9.66 v1(14.83,10.94)
CV_W4_PB11: length 19.1
  Top Layer w0.203: J4.4 4.95,11.43 v1(5.08,11.56) ; U1.25 19.33,10.46 18.99,10.8 18.99,10.99 v1(18.8,11.19)
  Bottom Layer w0.203: 18.47,11.12 16.29,11.12 15.85,11.56 8.03,11.56 7.98,11.51 7.52,11.51 7.48,11.56 v1(5.08,11.56)
CV_W5_PB4: length 19.5
  Top Layer w0.203: v1(16.89,16.17) 16.89,16.4 16.5,16.79 U1.41 ; J4.5 3.13,12.11 5.69,12.11 v1(7.64,14.05)
  Power / Signal w0.203: v1(16.89,16.17) 16.68,15.97 16.68,15.95 16.36,15.62 16.34,15.62 14.97,14.26 7.84,14.26 v1(7.64,14.05)
CV_W6_PB5: length 17.6
  Top Layer w0.203: U1.42 15.96,17.5 v1(15.96,18.44)
  Power / Signal w0.203: v1(10.86,19.65) 10.97,19.53 12.4,19.53 12.85,19.08 13.85,19.08 14.49,18.44 v1(15.96,18.44)
  Bottom Layer w0.203: v1(10.86,19.65) 9.53,18.32 9.53,18.19 8.87,17.53 2.29,17.53 J4.6
CV_W7_PB6: length 18.6
  Top Layer w0.203: U1.43 15.5,16.79 16.12,16.17 v1(16.13,16.17)
  Power / Signal w0.203: v1(8.98,18.42) 11.22,16.17 13.21,16.17 13.72,15.67 15.44,15.67 15.95,16.17 v1(16.13,16.17)
  Bottom Layer w0.203: v1(8.98,18.42) 5.79,18.42 5.01,19.2 4.14,19.2 3.48,18.54 1.78,18.54 J4.7
CV_W8_PB7: length 19.7
  Top Layer w0.203: J4.8 1.65,21.59 2.79,22.73 4.57,22.73 4.83,22.48 4.83,20.45 5.14,20.13 9.02,20.13 v1(9.61,19.55) ; U1.44 15,16.43 v1(15.21,16.22)
  Power / Signal w0.203: v1(9.61,19.55) 10.1,19.05 12.38,19.05 13.07,18.36 13.07,18.3 13.39,17.97 13.46,17.97 v1(15.21,16.22)
HSE_IN: length 7.9
  Top Layer w0.203: 11.18,9.59 10.73,10.03 9.95,10.03 9.61,10.38 ; X1.1 9.61,11.09 9.1,11.6 9.1,12.62 9.02,12.7 9.02,13.65 9.26,13.89 11.43,13.89 U1.5
HSE_OUT: length 8.2
  Top Layer w0.203: 7.41,8.67 5.99,8.67 C10.1 ; X1.3 7.75,8.8 8.51,9.56 8.51,11.06 8.36,11.2 8.36,11.21 8.21,11.36 7.68,11.36 7.2,11.84 7.2,12.31 7.85,12.95 8.14,12.95 8.39,13.21
LSE_IN: length 5.5
  Top Layer w0.203: 9.65,17.16 9.45,17.16 C11.1 ; X2.1 9.53,16.26 10.73,15.05 10.73,15.05 10.87,14.9 11.44,14.9 U1.3
LSE_OUT: length 3
  Top Layer w0.203: 10.79,14.48 10.43,14.85 8.07,14.85 C12.1
MCU_BOOT0: length 4.5
  Top Layer w0.203: 17.39,19.43 16.32,19.43 15.88,19 15.37,19 14.5,18.12 U1.45 ; 17.33,19.11 17.72,19.11
MCU_PB2_TP: length 15.4
  Top Layer w0.203: v1(16.44,10.21) 16.08,10.21 15.54,9.67 15.54,9 U1.18
  Power / Signal w0.203: v1(16.76,4.19) 16.44,4.52 16.44,8.29 17.95,9.8 17.95,10.26 17.63,10.59 17.17,10.59 16.97,10.39 16.9,10.39 16.72,10.21 v1(16.44,10.21)
  Bottom Layer w0.203: TP6.1 21.45,3.94 17.02,3.94 v1(16.76,4.19)
MCU_PF1_OSC_OUT: length 1.7
  Top Layer w0.203: U1.6 10.02,13.46 9.9,13.33
SYS_BOOT: length 7
  Top Layer w0.203: 15.38,19.69 14.74,19.69 13.97,20.45 13.97,22.48 12.32,24.13 J1.4
SYS_NRST: length 33.7
  Top Layer w0.203: R3.1 21.13,19.38 v1(21.13,20.83) ; C8.2 10.74,12.96 U1.7 12.7,12.96 12.7,12.96 v1(12.7,15.53)
  Bottom Layer w0.203: v1(12.7,15.53) 12.7,16.64 13.39,17.33 ; 13.39,17.33 17.65,21.59 TP5.1 20.37,21.59 v1(21.13,20.83) ; 13.39,17.33 13.39,17.97 13.07,18.3 13.07,18.43 11.18,20.32 9.27,20.32 8.85,20.74 8.85,22.53 8.65,22.73 8.59,22.73 arc(8.56,22.74) 8.52,22.74 6.72,22.74 arc(6.68,22.74) 6.65,22.73 5.21,22.73 J1.1
SYS_SWCLK: length 14.2
  Top Layer w0.203: TP4.1 16.46,20.37 17.26,20.37 17.31,20.32 18.45,20.32 18.45,18.57 18,18.12 U1.38
  Bottom Layer w0.203: J1.3 10.03,22.99 10.94,22.99 10.95,22.98 13.85,22.98 TP4.1
SYS_SWDIO: length 20.3
  Top Layer w0.203: J1.2 7.62,22.86 11.43,22.86 TP3.1 12.7,20.2 12.11,19.61 12.11,18.12 12.61,17.62 12.61,16.6 13.61,15.6 17.3,15.6 18.5,16.79 U1.37
USB_DM_PA11: length 11.7
  Top Layer w0.247: U1.33 19.2,14.46 18.54,15.11 18.54,16.3 19.94,17.7 19.94,22.61 19.05,23.5 J1.7
USB_DP_PA12: length 11.3
  Top Layer w0.247: U1.34 19.26,14.96 19.06,15.16 19.06,15.2 18.97,15.29 18.97,16.17 20.34,17.53 20.34,23.26 21.21,24.13 J1.8
$1N514: length 4
  Top Layer w0.203: 3.49,18.92 4.57,17.84 J8.2

## Copper pours and planes (outline as drawn; the poured copper is in the pictures)
GND on GND Plane: 0.25,25.15 25.15,25.15 25.15,0.25 0.25,0.25
VDD_CORE on Power / Signal: 0.25,25.15 25.15,25.15 25.15,0.29 2.54,0.29 2.54,2.29 0.25,2.29

Small or netless copper shapes (teardrops, artwork), in the pictures only: 3 on Top Layer

## Text on the board
Bottom Silkscreen Layer: MCU | LOGIC | CPU | FORMAT | CLOCK | CHECK ORIENTATION & PINOUT BEFORE INSERTION | DOCS  craftvia.org | X1 8M HSE / X2 32K LSE (DNP) | 170 MHz / 128 KB FLASH / 32 KB SRAM | 1.0 IN / 2.54 MM PITCH | STM32G431CBT6 | 3.3 V | CORE-S G431
Top Silkscreen Layer: VBAT | GND | PA13 | VDD | Core-S G431 / v1 Rev0 | PA14 | PB8 | SWDIO | PA15 | BOOT0 | PB3 | NRST | PA11 | PA12 | PB2 | N | PB7 | PB6 | PB5 | PB4 | PB11 | PB10 | PA10 | PA9 | +3V3 | PB15 | PB14 | PB13 | PB12 | PB9 | PB1 | PB0 | PA8 | PA0 | PA1 | PA2 | PA3 | PA4 | PA5 | PA6 | PA7 | PG10
